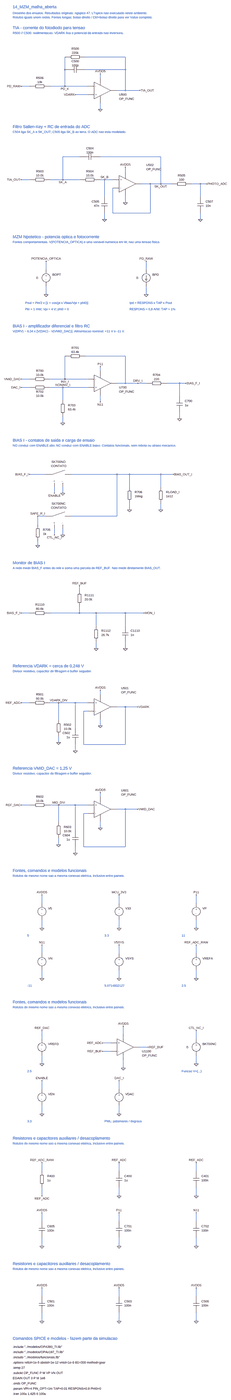
[diagram p0: schematic 14_MZM_malha_aberta.asc, whole sheet]
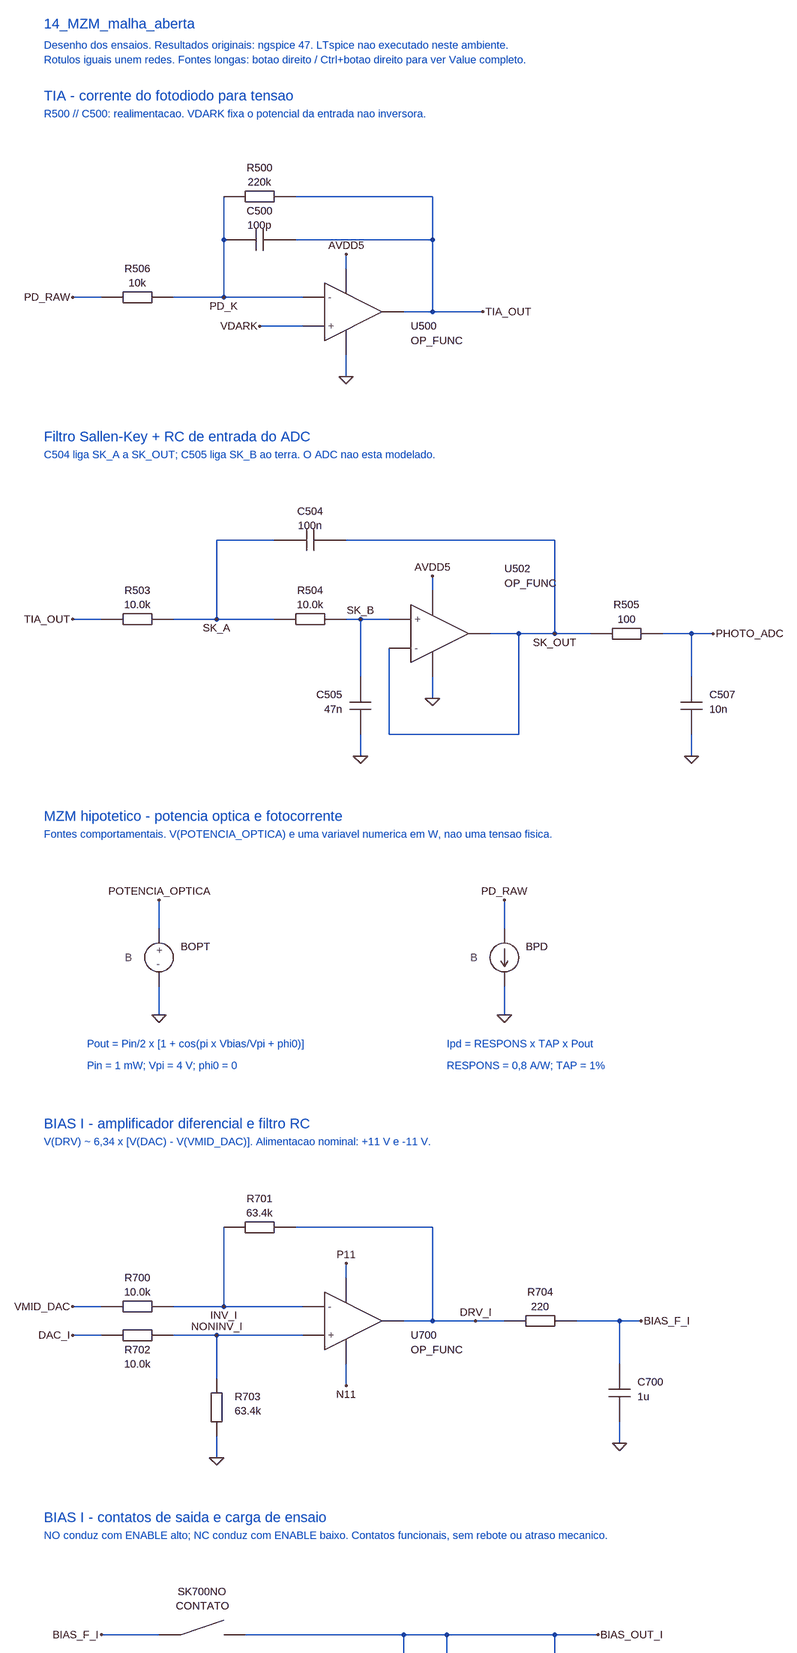
[diagram p1: schematic 14_MZM_malha_aberta.asc, part, row 1 of 3, column 1 of 1]
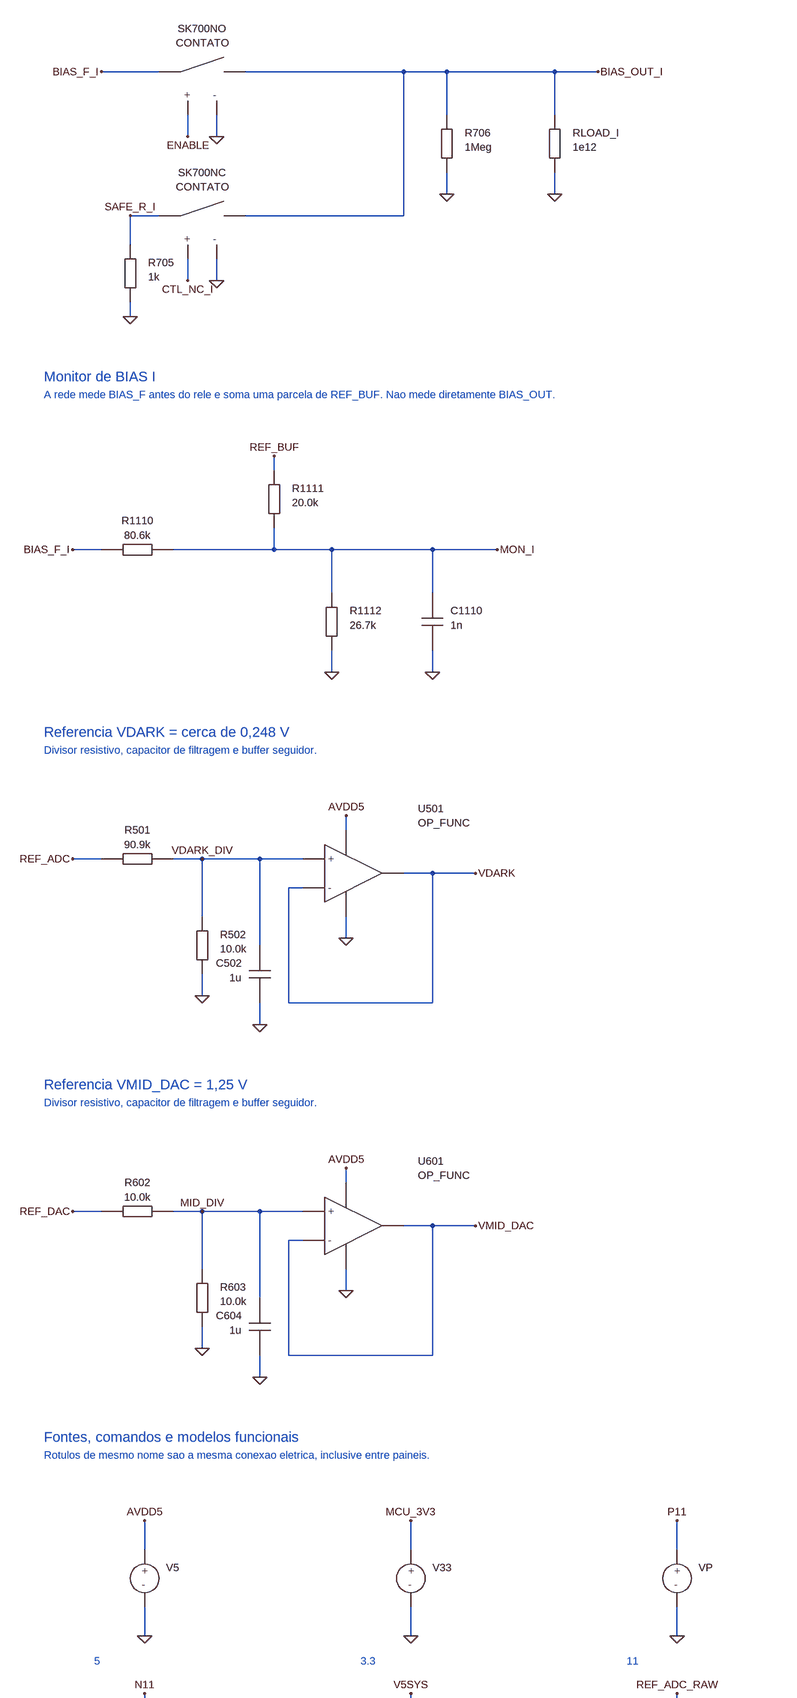
[diagram p2: schematic 14_MZM_malha_aberta.asc, part, row 2 of 3, column 1 of 1]
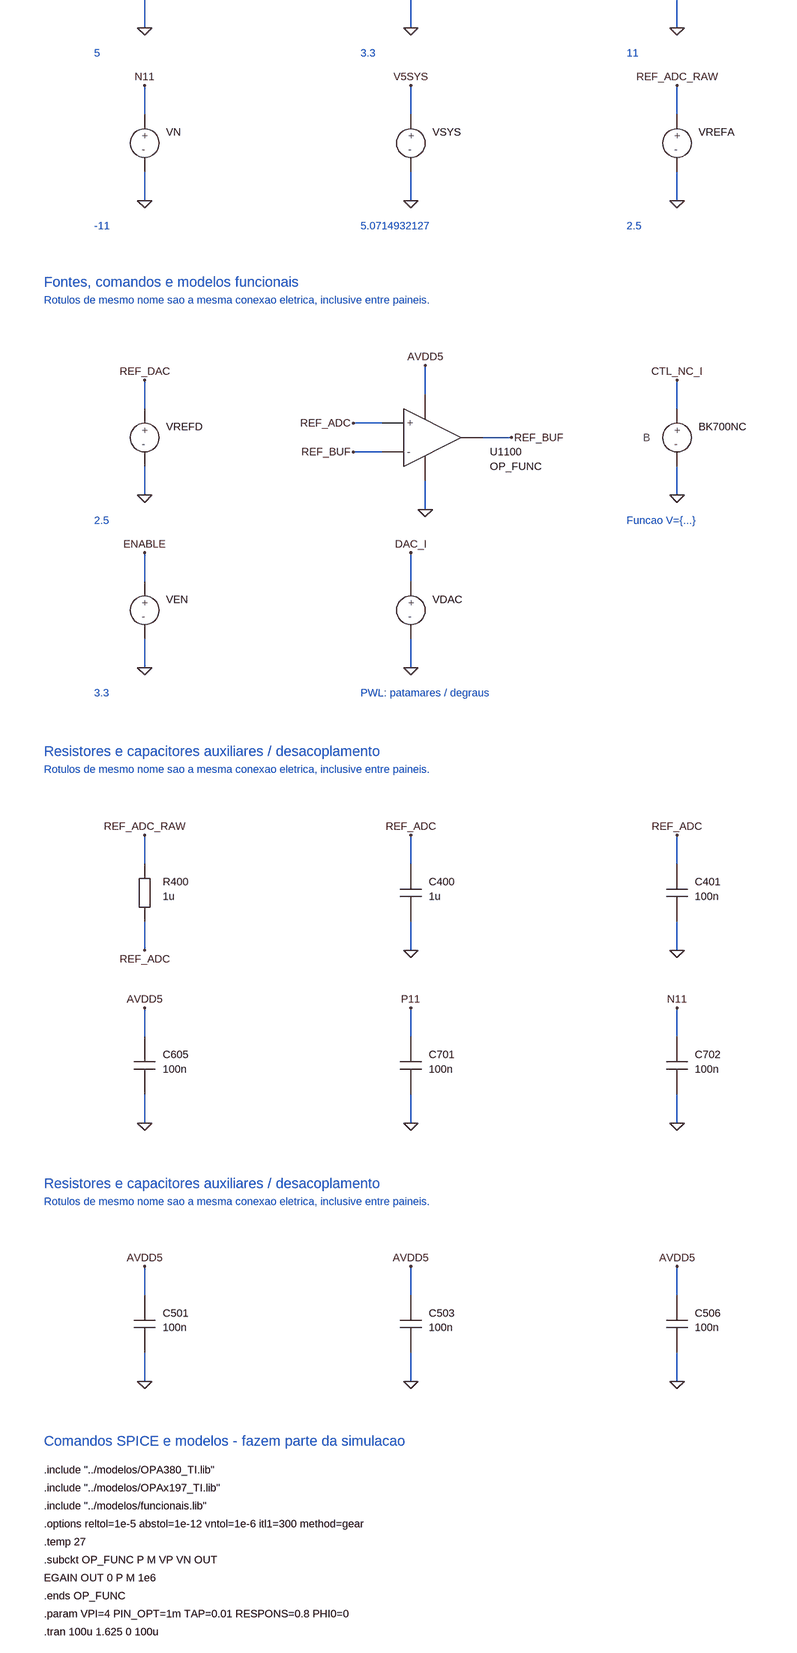
[diagram p3: schematic 14_MZM_malha_aberta.asc, part, row 3 of 3, column 1 of 1]
14_MZM_malha_aberta.asc, the LTspice schematic file:
Version 4.1
SHEET 1 1968 12720
TEXT 64 32 Left 3 ;14_MZM_malha_aberta
TEXT 64 80 Left 2 ;Desenho dos ensaios. Resultados originais: ngspice 47. LTspice nao executado neste ambiente.
TEXT 64 112 Left 2 ;Rotulos iguais unem redes. Fontes longas: botao direito / Ctrl+botao direito para ver Value completo.
TEXT 64 192 Left 3 ;TIA - corrente do fotodiodo para tensao
TEXT 64 232 Left 2 ;R500 // C500: realimentacao. VDARK fixa o potencial da entrada nao inversora.
WIRE 192 640 128 640
WIRE 352 640 640 640
WIRE 464 640 464 416
WIRE 624 416 928 416
WIRE 928 416 928 672
WIRE 928 672 864 672
WIRE 624 512 928 512
WIRE 736 576 736 544
WIRE 736 768 736 816
WIRE 640 704 544 704
WIRE 928 672 1040 672
FLAG 128 640 PD_RAW
FLAG 736 544 AVDD5
FLAG 736 816 0
FLAG 544 704 VDARK
FLAG 1040 672 TIA_OUT
FLAG 464 640 PD_K
SYMBOL CV_RH 192 640 R0
SYMATTR InstName R506
SYMATTR Value 10k
SYMBOL CV_RH 464 416 R0
SYMATTR InstName R500
SYMATTR Value 220k
SYMBOL CV_CH 464 512 R0
SYMATTR InstName C500
SYMATTR Value 100p
SYMBOL CV_OPD 704 608 R0
SYMATTR InstName U500
SYMATTR Value OP_FUNC
TEXT 64 1136 Left 3 ;Filtro Sallen-Key + RC de entrada do ADC
TEXT 64 1176 Left 2 ;C504 liga SK_A a SK_OUT; C505 liga SK_B ao terra. O ADC nao esta modelado.
WIRE 192 1552 128 1552
WIRE 352 1552 576 1552
WIRE 448 1552 448 1376
WIRE 448 1376 576 1376
WIRE 736 1376 1200 1376
WIRE 1200 1376 1200 1584
WIRE 928 1488 928 1456
WIRE 928 1680 928 1728
WIRE 736 1552 832 1552
WIRE 768 1552 768 1680
WIRE 768 1808 768 1856
WIRE 832 1616 832 1808
WIRE 832 1808 1120 1808
WIRE 1120 1808 1120 1584
WIRE 1056 1584 1280 1584
WIRE 1440 1584 1552 1584
WIRE 1504 1584 1504 1680
WIRE 1504 1808 1504 1856
FLAG 128 1552 TIA_OUT
FLAG 928 1456 AVDD5
FLAG 928 1728 0
FLAG 768 1856 0
FLAG 1552 1584 PHOTO_ADC
FLAG 1504 1856 0
FLAG 448 1552 SK_A
FLAG 768 1552 SK_B
FLAG 1200 1584 SK_OUT
SYMBOL CV_RH 192 1552 R0
SYMATTR InstName R503
SYMATTR Value 10.0k
SYMBOL CV_RH 576 1552 R0
SYMATTR InstName R504
SYMATTR Value 10.0k
SYMBOL CV_CH 576 1376 R0
SYMATTR InstName C504
SYMATTR Value 100n
SYMBOL CV_OPF 896 1520 R0
SYMATTR InstName U502
SYMATTR Value OP_FUNC
SYMBOL CV_CVL 768 1680 R0
SYMATTR InstName C505
SYMATTR Value 47n
SYMBOL CV_RH 1280 1584 R0
SYMATTR InstName R505
SYMATTR Value 100
SYMBOL CV_CV 1504 1680 R0
SYMATTR InstName C507
SYMATTR Value 10n
TEXT 64 2080 Left 3 ;MZM hipotetico - potencia optica e fotocorrente
TEXT 64 2120 Left 2 ;Fontes comportamentais. V(POTENCIA_OPTICA) e uma variavel numerica em W, nao uma tensao fisica.
WIRE 320 2368 320 2304
WIRE 320 2496 320 2560
WIRE 1088 2368 1088 2304
WIRE 1088 2496 1088 2560
FLAG 320 2304 POTENCIA_OPTICA
FLAG 320 2560 0
FLAG 1088 2304 PD_RAW
FLAG 1088 2560 0
SYMBOL CV_B 320 2368 R0
SYMATTR InstName BOPT
SYMATTR Value V={PIN_OPT*0.5*(1+cos(3.141592653589793*V(BIAS_OUT_I)/VPI+PHI0))}
SYMBOL CV_BI 1088 2368 R0
SYMATTR InstName BPD
SYMATTR Value I={RESPONS*TAP*V(POTENCIA_OPTICA)}
TEXT 160 2624 Left 2 ;Pout = Pin/2 x [1 + cos(pi x Vbias/Vpi + phi0)]
TEXT 960 2624 Left 2 ;Ipd = RESPONS x TAP x Pout
TEXT 160 2672 Left 2 ;Pin = 1 mW; Vpi = 4 V; phi0 = 0
TEXT 960 2672 Left 2 ;RESPONS = 0,8 A/W; TAP = 1%
TEXT 64 2960 Left 3 ;BIAS I - amplificador diferencial e filtro RC
TEXT 64 3000 Left 2 ;V(DRV) ~ 6,34 x [V(DAC) - V(VMID_DAC)]. Alimentacao nominal: +11 V e -11 V.
WIRE 192 3376 128 3376
WIRE 352 3376 640 3376
WIRE 464 3376 464 3200
WIRE 624 3200 928 3200
WIRE 928 3200 928 3408
WIRE 928 3408 864 3408
WIRE 192 3440 128 3440
WIRE 352 3440 640 3440
WIRE 448 3440 448 3536
WIRE 448 3664 448 3712
WIRE 736 3312 736 3280
WIRE 736 3504 736 3552
WIRE 928 3408 1088 3408
WIRE 1248 3408 1392 3408
WIRE 1344 3408 1344 3504
WIRE 1344 3632 1344 3680
FLAG 128 3376 VMID_DAC
FLAG 128 3440 DAC_I
FLAG 448 3712 0
FLAG 736 3280 P11
FLAG 736 3552 N11
FLAG 1024 3408 DRV_I
FLAG 1392 3408 BIAS_F_I
FLAG 1344 3680 0
FLAG 464 3376 INV_I
FLAG 448 3440 NONINV_I
SYMBOL CV_RH 192 3376 R0
SYMATTR InstName R700
SYMATTR Value 10.0k
SYMBOL CV_RHR 464 3200 R0
SYMATTR InstName R701
SYMATTR Value 63.4k
SYMBOL CV_RHB 192 3440 R0
SYMATTR InstName R702
SYMATTR Value 10.0k
SYMBOL CV_RV 448 3536 R0
SYMATTR InstName R703
SYMATTR Value 63.4k
SYMBOL CV_OPD 704 3344 R0
SYMATTR InstName U700
SYMATTR Value OP_FUNC
SYMBOL CV_RH 1088 3408 R0
SYMATTR InstName R704
SYMATTR Value 220
SYMBOL CV_CV 1344 3504 R0
SYMATTR InstName C700
SYMATTR Value 1u
TEXT 64 3968 Left 3 ;BIAS I - contatos de saida e carga de ensaio
TEXT 64 4008 Left 2 ;NO conduz com ENABLE alto; NC conduz com ENABLE baixo. Contatos funcionais, sem rebote ou atraso mecanico.
WIRE 320 4352 192 4352
WIRE 512 4352 1296 4352
WIRE 512 4672 864 4672
WIRE 864 4672 864 4352
WIRE 384 4448 384 4496
WIRE 448 4448 448 4496
WIRE 384 4768 384 4816
WIRE 448 4768 448 4816
WIRE 320 4672 256 4672
WIRE 256 4672 256 4736
WIRE 256 4864 256 4896
WIRE 960 4352 960 4448
WIRE 960 4576 960 4624
WIRE 1200 4352 1200 4448
WIRE 1200 4576 1200 4624
FLAG 192 4352 BIAS_F_I
FLAG 1296 4352 BIAS_OUT_I
FLAG 384 4496 ENABLE
FLAG 448 4496 0
FLAG 384 4816 CTL_NC_I
FLAG 448 4816 0
FLAG 256 4672 SAFE_R_I
FLAG 256 4896 0
FLAG 960 4624 0
FLAG 1200 4624 0
SYMBOL CV_SW 384 4352 R0
SYMATTR InstName SK700NO
SYMATTR Value CONTATO
SYMBOL CV_SW 384 4672 R0
SYMATTR InstName SK700NC
SYMATTR Value CONTATO
SYMBOL CV_RV 256 4736 R0
SYMATTR InstName R705
SYMATTR Value 1k
SYMBOL CV_RV 960 4448 R0
SYMATTR InstName R706
SYMATTR Value 1Meg
SYMBOL CV_RV 1200 4448 R0
SYMATTR InstName RLOAD_I
SYMATTR Value 1e12
TEXT 64 5120 Left 3 ;Monitor de BIAS I
TEXT 64 5160 Left 2 ;A rede mede BIAS_F antes do rele e soma uma parcela de REF_BUF. Nao mede diretamente BIAS_OUT.
WIRE 192 5504 128 5504
WIRE 352 5504 1072 5504
WIRE 576 5328 576 5296
WIRE 576 5456 576 5504
WIRE 704 5504 704 5600
WIRE 704 5728 704 5776
WIRE 928 5504 928 5600
WIRE 928 5728 928 5776
FLAG 128 5504 BIAS_F_I
FLAG 1072 5504 MON_I
FLAG 576 5296 REF_BUF
FLAG 704 5776 0
FLAG 928 5776 0
SYMBOL CV_RH 192 5504 R0
SYMATTR InstName R1110
SYMATTR Value 80.6k
SYMBOL CV_RV 576 5328 R0
SYMATTR InstName R1111
SYMATTR Value 20.0k
SYMBOL CV_RV 704 5600 R0
SYMATTR InstName R1112
SYMATTR Value 26.7k
SYMBOL CV_CV 928 5600 R0
SYMATTR InstName C1110
SYMATTR Value 1n
TEXT 64 6016 Left 3 ;Referencia VDARK = cerca de 0,248 V
TEXT 64 6056 Left 2 ;Divisor resistivo, capacitor de filtragem e buffer seguidor.
WIRE 192 6368 128 6368
WIRE 352 6368 640 6368
WIRE 416 6368 416 6496
WIRE 416 6624 416 6672
WIRE 544 6368 544 6560
WIRE 544 6688 544 6736
WIRE 736 6304 736 6272
WIRE 736 6496 736 6544
WIRE 640 6432 608 6432
WIRE 608 6432 608 6688
WIRE 608 6688 928 6688
WIRE 928 6688 928 6400
WIRE 928 6400 864 6400
WIRE 928 6400 1024 6400
FLAG 128 6368 REF_ADC
FLAG 416 6672 0
FLAG 544 6736 0
FLAG 736 6272 AVDD5
FLAG 736 6544 0
FLAG 1024 6400 VDARK
FLAG 416 6368 VDARK_DIV
SYMBOL CV_RH 192 6368 R0
SYMATTR InstName R501
SYMATTR Value 90.9k
SYMBOL CV_RV 416 6496 R0
SYMATTR InstName R502
SYMATTR Value 10.0k
SYMBOL CV_CVL 544 6560 R0
SYMATTR InstName C502
SYMATTR Value 1u
SYMBOL CV_OPF 704 6336 R0
SYMATTR InstName U501
SYMATTR Value OP_FUNC
TEXT 64 6976 Left 3 ;Referencia VMID_DAC = 1,25 V
TEXT 64 7016 Left 2 ;Divisor resistivo, capacitor de filtragem e buffer seguidor.
WIRE 192 7328 128 7328
WIRE 352 7328 640 7328
WIRE 416 7328 416 7456
WIRE 416 7584 416 7632
WIRE 544 7328 544 7520
WIRE 544 7648 544 7696
WIRE 736 7264 736 7232
WIRE 736 7456 736 7504
WIRE 640 7392 608 7392
WIRE 608 7392 608 7648
WIRE 608 7648 928 7648
WIRE 928 7648 928 7360
WIRE 928 7360 864 7360
WIRE 928 7360 1024 7360
FLAG 128 7328 REF_DAC
FLAG 416 7632 0
FLAG 544 7696 0
FLAG 736 7232 AVDD5
FLAG 736 7504 0
FLAG 1024 7360 VMID_DAC
FLAG 416 7328 MID_DIV
SYMBOL CV_RH 192 7328 R0
SYMATTR InstName R602
SYMATTR Value 10.0k
SYMBOL CV_RV 416 7456 R0
SYMATTR InstName R603
SYMATTR Value 10.0k
SYMBOL CV_CVL 544 7520 R0
SYMATTR InstName C604
SYMATTR Value 1u
SYMBOL CV_OPF 704 7296 R0
SYMATTR InstName U601
SYMATTR Value OP_FUNC
TEXT 64 7936 Left 3 ;Fontes, comandos e modelos funcionais
TEXT 64 7976 Left 2 ;Rotulos de mesmo nome sao a mesma conexao eletrica, inclusive entre paineis.
WIRE 288 8256 288 8192
WIRE 288 8384 288 8448
WIRE 880 8256 880 8192
WIRE 880 8384 880 8448
WIRE 1472 8256 1472 8192
WIRE 1472 8384 1472 8448
WIRE 288 8640 288 8576
WIRE 288 8768 288 8832
WIRE 880 8640 880 8576
WIRE 880 8768 880 8832
WIRE 1472 8640 1472 8576
WIRE 1472 8768 1472 8832
FLAG 288 8192 AVDD5
FLAG 288 8448 0
FLAG 880 8192 MCU_3V3
FLAG 880 8448 0
FLAG 1472 8192 P11
FLAG 1472 8448 0
FLAG 288 8576 N11
FLAG 288 8832 0
FLAG 880 8576 V5SYS
FLAG 880 8832 0
FLAG 1472 8576 REF_ADC_RAW
FLAG 1472 8832 0
SYMBOL CV_V 288 8256 R0
SYMATTR InstName V5
SYMATTR Value 5
SYMBOL CV_V 880 8256 R0
SYMATTR InstName V33
SYMATTR Value 3.3
SYMBOL CV_V 1472 8256 R0
SYMATTR InstName VP
SYMATTR Value 11
SYMBOL CV_V 288 8640 R0
SYMATTR InstName VN
SYMATTR Value -11
SYMBOL CV_V 880 8640 R0
SYMATTR InstName VSYS
SYMATTR Value 5.0714932127
SYMBOL CV_V 1472 8640 R0
SYMATTR InstName VREFA
SYMATTR Value 2.5
TEXT 176 8504 Left 2 ;5
TEXT 768 8504 Left 2 ;3.3
TEXT 1360 8504 Left 2 ;11
TEXT 176 8888 Left 2 ;-11
TEXT 768 8888 Left 2 ;5.0714932127
TEXT 1360 8888 Left 2 ;2.5
TEXT 64 9088 Left 3 ;Fontes, comandos e modelos funcionais
TEXT 64 9128 Left 2 ;Rotulos de mesmo nome sao a mesma conexao eletrica, inclusive entre paineis.
WIRE 288 9408 288 9344
WIRE 288 9536 288 9600
WIRE 816 9440 752 9440
WIRE 816 9504 752 9504
WIRE 912 9376 912 9312
WIRE 912 9568 912 9632
WIRE 1040 9472 1104 9472
WIRE 1472 9408 1472 9344
WIRE 1472 9536 1472 9600
WIRE 288 9792 288 9728
WIRE 288 9920 288 9984
WIRE 880 9792 880 9728
WIRE 880 9920 880 9984
FLAG 288 9344 REF_DAC
FLAG 288 9600 0
FLAG 752 9440 REF_ADC
FLAG 752 9504 REF_BUF
FLAG 912 9312 AVDD5
FLAG 912 9632 0
FLAG 1104 9472 REF_BUF
FLAG 1472 9344 CTL_NC_I
FLAG 1472 9600 0
FLAG 288 9728 ENABLE
FLAG 288 9984 0
FLAG 880 9728 DAC_I
FLAG 880 9984 0
SYMBOL CV_V 288 9408 R0
SYMATTR InstName VREFD
SYMATTR Value 2.5
SYMBOL CV_OP 880 9408 R0
SYMATTR InstName U1100
SYMATTR Value OP_FUNC
SYMBOL CV_B 1472 9408 R0
SYMATTR InstName BK700NC
SYMATTR Value V={3.3-V(ENABLE)}
SYMBOL CV_V 288 9792 R0
SYMATTR InstName VEN
SYMATTR Value 3.3
SYMBOL CV_V 880 9792 R0
SYMATTR InstName VDAC
SYMATTR Value PWL(0 0.5 0.1 0.5 0.12499 0.5 0.125 0.525 0.14999 0.525 0.15 0.55 0.17499 0.55 0.175 0.575 0.19999 0.575 0.2 0.6 0.22499 0.6 0.225 0.625 0.24999 0.625 0.25 0.65 0.27499 0.65 0.275 0.675 0.29999 0.675 0.3 0.7 0.32499 0.7 0.325 0.725 0.34999 0.725 0.35 0.75 0.37499 0.75 0.375 0.775 0.39999 0.775 0.4 0.8 0.42499 0.8 0.425 0.825 0.44999 0.825 0.45 0.85 0.47499 0.85 0.475 0.875 0.49999 0.875 0.5 0.9 0.52499 0.9 0.525 0.925 0.54999 0.925 0.55 0.95 0.57499 0.95 0.575 0.975 0.59999 0.975 0.6 1 0.62499 1 0.625 1.025 0.64999 1.025 0.65 1.05 0.67499 1.05 0.675 1.075 0.69999 1.075 0.7 1.1 0.72499 1.1 0.725 1.125 0.74999 1.125 0.75 1.15 0.77499 1.15 0.775 1.175 0.79999 1.175 0.8 1.2 0.82499 1.2 0.825 1.225 0.84999 1.225 0.85 1.25 0.87499 1.25 0.875 1.275 0.89999 1.275 0.9 1.3 0.92499 1.3 0.925 1.325 0.94999 1.325 0.95 1.35 0.97499 1.35 0.975 1.375 0.99999 1.375 1 1.4 1.02499 1.4 1.025 1.425 1.04999 1.425 1.05 1.45 1.07499 1.45 1.075 1.475 1.09999 1.475 1.1 1.5 1.12499 1.5 1.125 1.525 1.14999 1.525 1.15 1.55 1.17499 1.55 1.175 1.575 1.19999 1.575 1.2 1.6 1.22499 1.6 1.225 1.625 1.24999 1.625 1.25 1.65 1.27499 1.65 1.275 1.675 1.29999 1.675 1.3 1.7 1.32499 1.7 1.325 1.725 1.34999 1.725 1.35 1.75 1.37499 1.75 1.375 1.775 1.39999 1.775 1.4 1.8 1.42499 1.8 1.425 1.825 1.44999 1.825 1.45 1.85 1.47499 1.85 1.475 1.875 1.49999 1.875 1.5 1.9 1.52499 1.9 1.525 1.925 1.54999 1.925 1.55 1.95 1.57499 1.95 1.575 1.975 1.59999 1.975 1.6 2 1.62499 2 1.625 2)
TEXT 176 9656 Left 2 ;2.5
TEXT 1360 9656 Left 2 ;Funcao V={...}
TEXT 176 10040 Left 2 ;3.3
TEXT 768 10040 Left 2 ;PWL: patamares / degraus
TEXT 64 10240 Left 3 ;Resistores e capacitores auxiliares / desacoplamento
TEXT 64 10280 Left 2 ;Rotulos de mesmo nome sao a mesma conexao eletrica, inclusive entre paineis.
WIRE 288 10560 288 10496
WIRE 288 10688 288 10752
WIRE 880 10560 880 10496
WIRE 880 10688 880 10752
WIRE 1472 10560 1472 10496
WIRE 1472 10688 1472 10752
WIRE 288 10944 288 10880
WIRE 288 11072 288 11136
WIRE 880 10944 880 10880
WIRE 880 11072 880 11136
WIRE 1472 10944 1472 10880
WIRE 1472 11072 1472 11136
FLAG 288 10496 REF_ADC_RAW
FLAG 288 10752 REF_ADC
FLAG 880 10496 REF_ADC
FLAG 880 10752 0
FLAG 1472 10496 REF_ADC
FLAG 1472 10752 0
FLAG 288 10880 AVDD5
FLAG 288 11136 0
FLAG 880 10880 P11
FLAG 880 11136 0
FLAG 1472 10880 N11
FLAG 1472 11136 0
SYMBOL CV_RV 288 10560 R0
SYMATTR InstName R400
SYMATTR Value 1u
SYMBOL CV_CV 880 10560 R0
SYMATTR InstName C400
SYMATTR Value 1u
SYMBOL CV_CV 1472 10560 R0
SYMATTR InstName C401
SYMATTR Value 100n
SYMBOL CV_CV 288 10944 R0
SYMATTR InstName C605
SYMATTR Value 100n
SYMBOL CV_CV 880 10944 R0
SYMATTR InstName C701
SYMATTR Value 100n
SYMBOL CV_CV 1472 10944 R0
SYMATTR InstName C702
SYMATTR Value 100n
TEXT 64 11392 Left 3 ;Resistores e capacitores auxiliares / desacoplamento
TEXT 64 11432 Left 2 ;Rotulos de mesmo nome sao a mesma conexao eletrica, inclusive entre paineis.
WIRE 288 11712 288 11648
WIRE 288 11840 288 11904
WIRE 880 11712 880 11648
WIRE 880 11840 880 11904
WIRE 1472 11712 1472 11648
WIRE 1472 11840 1472 11904
FLAG 288 11648 AVDD5
FLAG 288 11904 0
FLAG 880 11648 AVDD5
FLAG 880 11904 0
FLAG 1472 11648 AVDD5
FLAG 1472 11904 0
SYMBOL CV_CV 288 11712 R0
SYMATTR InstName C501
SYMATTR Value 100n
SYMBOL CV_CV 880 11712 R0
SYMATTR InstName C503
SYMATTR Value 100n
SYMBOL CV_CV 1472 11712 R0
SYMATTR InstName C506
SYMATTR Value 100n
TEXT 64 12160 Left 3 ;Comandos SPICE e modelos - fazem parte da simulacao
TEXT 64 12224 Left 2 !.include "../modelos/OPA380_TI.lib"
TEXT 64 12264 Left 2 !.include "../modelos/OPAx197_TI.lib"
TEXT 64 12304 Left 2 !.include "../modelos/funcionais.lib"
TEXT 64 12344 Left 2 !.options reltol=1e-5 abstol=1e-12 vntol=1e-6 itl1=300 method=gear
TEXT 64 12384 Left 2 !.temp 27
TEXT 64 12424 Left 2 !.subckt OP_FUNC P M VP VN OUT
TEXT 64 12464 Left 2 !EGAIN OUT 0 P M 1e6
TEXT 64 12504 Left 2 !.ends OP_FUNC
TEXT 64 12544 Left 2 !.param VPI=4 PIN_OPT=1m TAP=0.01 RESPONS=0.8 PHI0=0
TEXT 64 12584 Left 2 !.tran 100u 1.625 0 100u

The netlist it stands for:
* 14_MZM_malha_aberta.asc
R506 PD_RAW PD_K 10k
R500 PD_K TIA_OUT 220k
C500 PD_K TIA_OUT 100p
X§U500 VDARK PD_K AVDD5 0 TIA_OUT OP_FUNC  ; pins + - V+ V- OUT
R503 TIA_OUT SK_A 10.0k
R504 SK_A SK_B 10.0k
C504 SK_A SK_OUT 100n
X§U502 SK_B SK_OUT AVDD5 0 SK_OUT OP_FUNC  ; pins + - V+ V- OUT
C505 SK_B 0 47n
R505 SK_OUT PHOTO_ADC 100
C507 PHOTO_ADC 0 10n
BOPT POTENCIA_OPTICA 0 V={PIN_OPT*0.5*(1+cos(3.141592653589793*V(BIAS_OUT_I)/VPI+PHI0))}
BPD PD_RAW 0 I={RESPONS*TAP*V(POTENCIA_OPTICA)}
R700 VMID_DAC INV_I 10.0k
R701 DRV_I INV_I 63.4k
R702 DAC_I NONINV_I 10.0k
R703 NONINV_I 0 63.4k
X§U700 NONINV_I INV_I P11 N11 DRV_I OP_FUNC  ; pins + - V+ V- OUT
R704 DRV_I BIAS_F_I 220
C700 BIAS_F_I 0 1u
SK700NO BIAS_F_I BIAS_OUT_I ENABLE 0 CONTATO
SK700NC SAFE_R_I BIAS_OUT_I CTL_NC_I 0 CONTATO
R705 SAFE_R_I 0 1k
R706 BIAS_OUT_I 0 1Meg
RLOAD_I BIAS_OUT_I 0 1e12
R1110 BIAS_F_I MON_I 80.6k
R1111 REF_BUF MON_I 20.0k
R1112 MON_I 0 26.7k
C1110 MON_I 0 1n
R501 REF_ADC VDARK_DIV 90.9k
R502 VDARK_DIV 0 10.0k
C502 VDARK_DIV 0 1u
X§U501 VDARK_DIV VDARK AVDD5 0 VDARK OP_FUNC  ; pins + - V+ V- OUT
R602 REF_DAC MID_DIV 10.0k
R603 MID_DIV 0 10.0k
C604 MID_DIV 0 1u
X§U601 MID_DIV VMID_DAC AVDD5 0 VMID_DAC OP_FUNC  ; pins + - V+ V- OUT
V5 AVDD5 0 5
V33 MCU_3V3 0 3.3
VP P11 0 11
VN N11 0 -11
VSYS V5SYS 0 5.0714932127
VREFA REF_ADC_RAW 0 2.5
VREFD REF_DAC 0 2.5
X§U1100 REF_ADC REF_BUF AVDD5 0 REF_BUF OP_FUNC  ; pins + - V+ V- OUT
BK700NC CTL_NC_I 0 V={3.3-V(ENABLE)}
VEN ENABLE 0 3.3
VDAC DAC_I 0 PWL(0 0.5 0.1 0.5 0.12499 0.5 0.125 0.525 0.14999 0.525 0.15 0.55 0.17499 0.55 0.175 0.575 0.19999 0.575 0.2 0.6 0.22499 0.6 0.225 0.625 0.24999 0.625 0.25 0.65 0.27499 0.65 0.275 0.675 0.29999 0.675 0.3 0.7 0.32499 0.7 0.325 0.725 0.34999 0.725 0.35 0.75 0.37499 0.75 0.375 0.775 0.39999 0.775 0.4 0.8 0.42499 0.8 0.425 0.825 0.44999 0.825 0.45 0.85 0.47499 0.85 0.475 0.875 0.49999 0.875 0.5 0.9 0.52499 0.9 0.525 0.925 0.54999 0.925 0.55 0.95 0.57499 0.95 0.575 0.975 0.59999 0.975 0.6 1 0.62499 1 0.625 1.025 0.64999 1.025 0.65 1.05 0.67499 1.05 0.675 1.075 0.69999 1.075 0.7 1.1 0.72499 1.1 0.725 1.125 0.74999 1.125 0.75 1.15 0.77499 1.15 0.775 1.175 0.79999 1.175 0.8 1.2 0.82499 1.2 0.825 1.225 0.84999 1.225 0.85 1.25 0.87499 1.25 0.875 1.275 0.89999 1.275 0.9 1.3 0.92499 1.3 0.925 1.325 0.94999 1.325 0.95 1.35 0.97499 1.35 0.975 1.375 0.99999 1.375 1 1.4 1.02499 1.4 1.025 1.425 1.04999 1.425 1.05 1.45 1.07499 1.45 1.075 1.475 1.09999 1.475 1.1 1.5 1.12499 1.5 1.125 1.525 1.14999 1.525 1.15 1.55 1.17499 1.55 1.175 1.575 1.19999 1.575 1.2 1.6 1.22499 1.6 1.225 1.625 1.24999 1.625 1.25 1.65 1.27499 1.65 1.275 1.675 1.29999 1.675 1.3 1.7 1.32499 1.7 1.325 1.725 1.34999 1.725 1.35 1.75 1.37499 1.75 1.375 1.775 1.39999 1.775 1.4 1.8 1.42499 1.8 1.425 1.825 1.44999 1.825 1.45 1.85 1.47499 1.85 1.475 1.875 1.49999 1.875 1.5 1.9 1.52499 1.9 1.525 1.925 1.54999 1.925 1.55 1.95 1.57499 1.95 1.575 1.975 1.59999 1.975 1.6 2 1.62499 2 1.625 2)
R400 REF_ADC_RAW REF_ADC 1u
C400 REF_ADC 0 1u
C401 REF_ADC 0 100n
C605 AVDD5 0 100n
C701 P11 0 100n
C702 N11 0 100n
C501 AVDD5 0 100n
C503 AVDD5 0 100n
C506 AVDD5 0 100n
* 14_MZM_malha_aberta
* Desenho dos ensaios. Resultados originais: ngspice 47. LTspice nao executado neste ambiente.
* Rotulos iguais unem redes. Fontes longas: botao direito / Ctrl+botao direito para ver Value completo.
* TIA - corrente do fotodiodo para tensao
* R500 // C500: realimentacao. VDARK fixa o potencial da entrada nao inversora.
* Filtro Sallen-Key + RC de entrada do ADC
* C504 liga SK_A a SK_OUT; C505 liga SK_B ao terra. O ADC nao esta modelado.
* MZM hipotetico - potencia optica e fotocorrente
* Fontes comportamentais. V(POTENCIA_OPTICA) e uma variavel numerica em W, nao uma tensao fisica.
* Pout = Pin/2 x [1 + cos(pi x Vbias/Vpi + phi0)]
* Ipd = RESPONS x TAP x Pout
* Pin = 1 mW; Vpi = 4 V; phi0 = 0
* RESPONS = 0,8 A/W; TAP = 1%
* BIAS I - amplificador diferencial e filtro RC
* V(DRV) ~ 6,34 x [V(DAC) - V(VMID_DAC)]. Alimentacao nominal: +11 V e -11 V.
* BIAS I - contatos de saida e carga de ensaio
* NO conduz com ENABLE alto; NC conduz com ENABLE baixo. Contatos funcionais, sem rebote ou atraso mecanico.
* Monitor de BIAS I
* A rede mede BIAS_F antes do rele e soma uma parcela de REF_BUF. Nao mede diretamente BIAS_OUT.
* Referencia VDARK = cerca de 0,248 V
* Divisor resistivo, capacitor de filtragem e buffer seguidor.
* Referencia VMID_DAC = 1,25 V
* Divisor resistivo, capacitor de filtragem e buffer seguidor.
* Fontes, comandos e modelos funcionais
* Rotulos de mesmo nome sao a mesma conexao eletrica, inclusive entre paineis.
* 5
* 3.3
* 11
* -11
* 5.0714932127
* 2.5
* Fontes, comandos e modelos funcionais
* Rotulos de mesmo nome sao a mesma conexao eletrica, inclusive entre paineis.
* 2.5
* Funcao V={...}
* 3.3
* PWL: patamares / degraus
* Resistores e capacitores auxiliares / desacoplamento
* Rotulos de mesmo nome sao a mesma conexao eletrica, inclusive entre paineis.
* Resistores e capacitores auxiliares / desacoplamento
* Rotulos de mesmo nome sao a mesma conexao eletrica, inclusive entre paineis.
* Comandos SPICE e modelos - fazem parte da simulacao
.include "../modelos/OPA380_TI.lib"
.include "../modelos/OPAx197_TI.lib"
.include "../modelos/funcionais.lib"
.options reltol=1e-5 abstol=1e-12 vntol=1e-6 itl1=300 method=gear
.temp 27
.subckt OP_FUNC P M VP VN OUT
EGAIN OUT 0 P M 1e6
.ends OP_FUNC
.param VPI=4 PIN_OPT=1m TAP=0.01 RESPONS=0.8 PHI0=0
.tran 100u 1.625 0 100u
.backanno
.end